# Altium schematic sheet Core.SchDoc
size A4; SheetNumber: 1; SheetTotal: 3
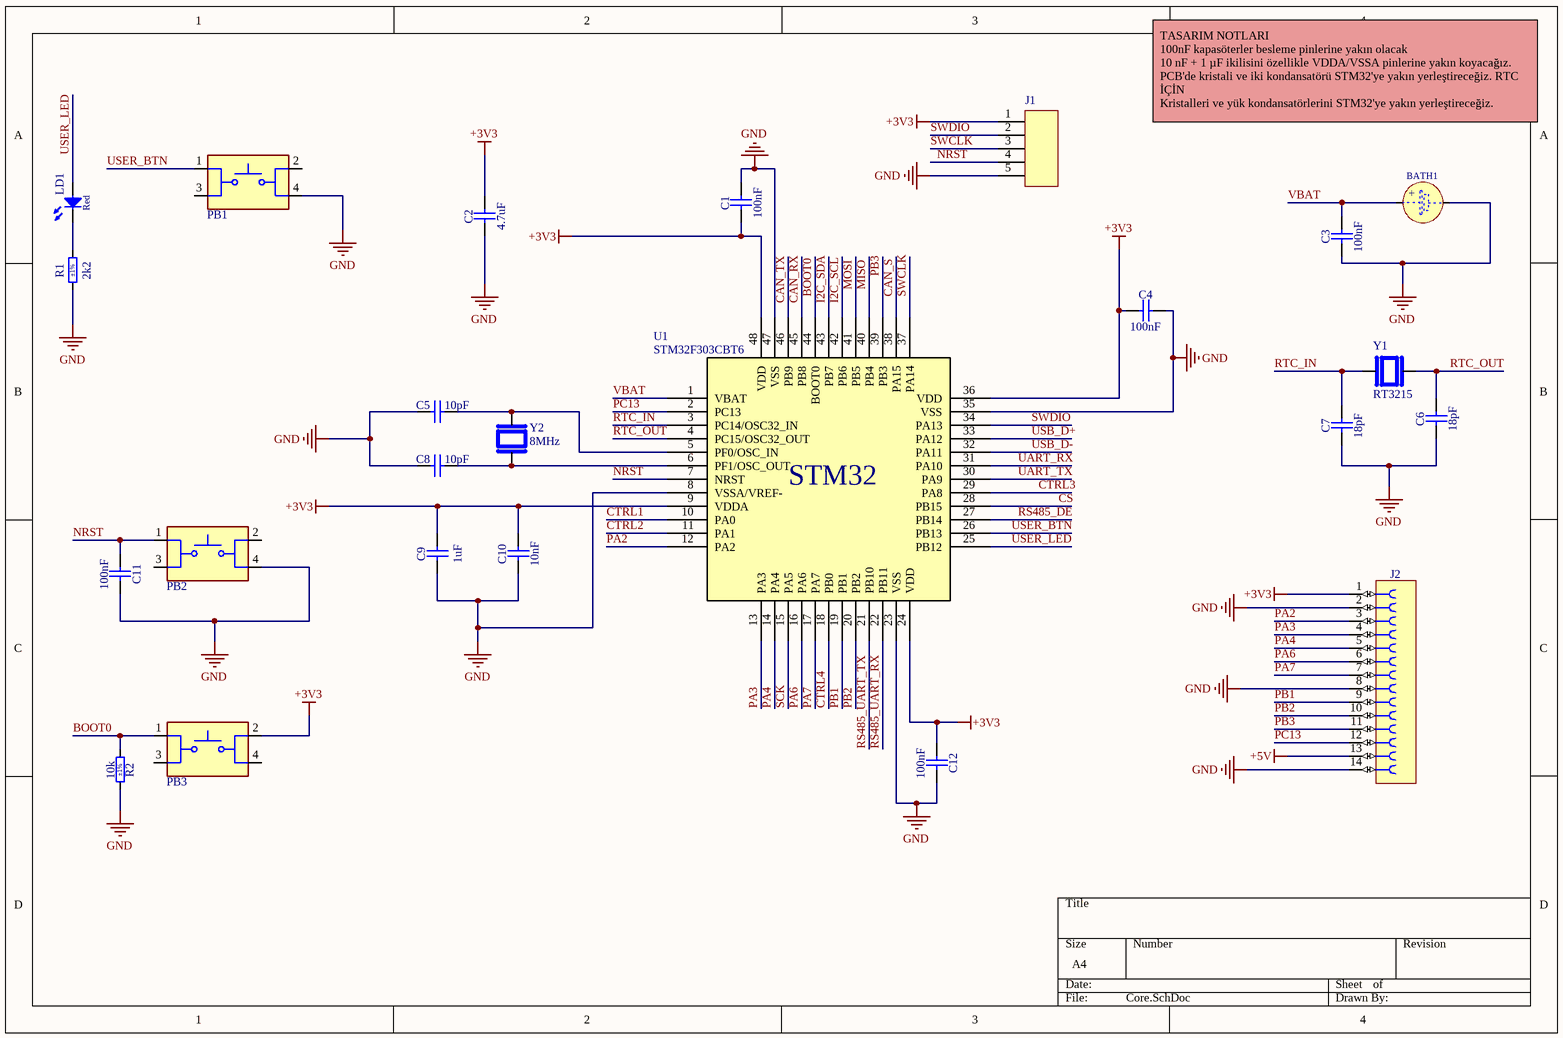
[diagram p0: Core.SchDoc]

## Parts
BATH1  (no value)  [BATH_KEYSTONE_3000]
C1  100nF  [CAPC1608X87N]
C2  4.7uF  [CAPC1608X90N]
C3  100nF  [CAPC1608X87N]
C4  100nF  [CAPC1608X87N]
C5  10pF  [CAPC1608X87N]
C6  18pF  [CAPC1608X87N]
C7  18pF  [CAPC1608X87N]
C8  10pF  [CAPC1608X87N]
C9  1uF  [CAPC1608X87N]
C10  10nF  [CAPC1608X87N]
C11  100nF  [CAPC1608X87N]
C12  100nF  [CAPC1608X87N]
J1  Pin Header 1x5  [Pin Header 1x5 2.54mm]  (value not drawn)
J2  Socket 14  [SAMTEC_SSW-107-01-G-D]  (value not drawn)
LD1  Red  [LED_KINGBRIGHT_KPH-1608SURCK]
PB1  4.5mm x 4.5mm  [L-KLS7-TS4502-6.5-180-T]  (value not drawn)
PB2  4.5mm x 4.5mm  [L-KLS7-TS4502-6.5-180-T]  (value not drawn)
PB3  4.5mm x 4.5mm  [L-KLS7-TS4502-6.5-180-T]  (value not drawn)
R1  2k2  Tolerance: ±1%  [RESC1608X55N]
R2  10k  Tolerance: ±1%  [RESC1608X55N]
U1  STM32F303CBT6  [STM32F303CBT6]
Y1  RT3215  [RT3215-32.768-12.5-TR]
Y2  8MHz  [H130A-8.000-8-2030-TR]

## Nets
+3V3: C1.1 C2.2 C4.1 C9.2 C10.2 C12.1 J1.1 J2.1 PB3.2 U1.9(VDDA) U1.24(VDD) U1.36(VDD) U1.48(VDD)
+5V: J2.13
GND: BATH1.2(MINUS) C1.2 C2.1 C3.1 C4.2 C5.1 C6.1 C7.1 C8.1 C9.1 C10.1 C11.2 C12.2 J1.5 J2.2 J2.8 J2.14 PB1.4 PB2.4 R1.1 R2.2 U1.8(VSSA/VREF-) U1.23(VSS) U1.35(VSS) U1.47(VSS)
BOOT0: PB3.1 R2.1 U1.44(BOOT0)
CAN_RX: U1.45(PB8)
CAN_S: U1.38(PA15)
CAN_TX: U1.46(PB9)
CS: U1.28(PB15)
CTRL1: U1.10(PA0)
CTRL2: U1.11(PA1)
CTRL3: U1.29(PA8)
CTRL4: U1.18(PB0)
I2C_SCL: U1.42(PB6)
I2C_SDA: U1.43(PB7)
MISO: U1.40(PB4)
MOSI: U1.41(PB5)
NRST: C11.1 J1.4 PB2.1 U1.7(NRST)
PA2: J2.3 U1.12(PA2)
PA3: J2.4 U1.13(PA3)
PA4: J2.5 U1.14(PA4)
PA6: J2.6 U1.16(PA6)
PA7: J2.7 U1.17(PA7)
PB1: J2.9 U1.19(PB1)
PB2: J2.10 U1.20(PB2)
PB3: J2.11 U1.39(PB3)
PC13: J2.12 U1.2(PC13)
RS485_DE: U1.27(PB14)
RS485_UART_RX: U1.22(PB11)
RS485_UART_TX: U1.21(PB10)
RTC_IN: C7.2 U1.3(PC14/OSC32_IN) Y1.1
RTC_OUT: C6.2 U1.4(PC15/OSC32_OUT) Y1.2
SCK: U1.15(PA5)
SWCLK: J1.3 U1.37(PA14)
SWDIO: J1.2 U1.34(PA13)
UART_RX: U1.31(PA10)
UART_TX: U1.30(PA9)
USB_D+: U1.33(PA12)
USB_D-: U1.32(PA11)
USER_BTN: PB1.1 U1.26(PB13)
USER_LED: LD1.2(A) U1.25(PB12)
VBAT: BATH1.1(PLUS) C3.2 U1.1(VBAT)
NetC5_2: C5.2 U1.5(PF0/OSC_IN) Y2.2
NetC8_2: C8.2 U1.6(PF1/OSC_OUT) Y2.1
NetLD1_1: LD1.1(C) R1.2

Not connected (* = marked no-connect by the designer): PB1 2 3; PB2 2 3; PB3 3 4

## Notes on the sheet
- TASARIM NOTLARI
  100nF kapasöterler besleme pinlerine yakın olacak
  10 nF + 1 µF ikilisini özellikle VDDA/VSSA pinlerine yakın koyacağız.
  PCB'de kristali ve iki kondansatörü STM32'ye yakın yerleştireceğiz. RTC İÇİN
  Kristalleri ve yük kondansatörlerini STM32'ye yakın yerleştireceğiz.
- (in symbol BATH_KEYSTONE_3000) +
- (in symbol STM32F303CBT6) STM32

## Library data of the parts
BATH1 = BATH_KEYSTONE_3000: Battery Holder whit 2 Pin; Part Description: SMD Battery Holder for CR1216, BR1220, CL1225, SR1120, D381, 391, 191 Coin Cells; Manufacturer Part Number: 3000; PressFit: No; Part Number: BATH_KEYSTONE_3000; Component Kind: Standard; Component Type: Standard; Pin Count: 3; PackageDescription: SMD Battery Holder for CR1216, BR1220, CL1225, SR1120, D381, 391, 191 Coin Cells; Family: Battery; Mounted: Yes; Socket: No; SMD: Yes; Sense: No; Manufacturer: KEYSTONE; ComponentHeight: 3.17mm; HelpURL: \\cern.ch\dfs\Applications\Altium\Datasheets\BATH_KEYSTONE_3000.pdf; Author: CERN DEM JLC; CreateDate: 17.04.2012; LatestRevisionDate: 7.06.2017
C1 C3 C4 C11 C12 = CC0603_100NF_50V_10%_X5R: Non-polarised capacitor; Part Description: SMD Multilayer Chip Ceramic Capacitor; Manufacturer: GENERIC; Manufacturer1 Part Number: C1608X5R1H104K080; Voltage: 50V; TC: X5R; Tolerance: ±10%; Part Number: CC0603_100NF_50V_10%_X5R; Component Kind: Standard; Component Type: Standard; Pin Count: 2; Value: 100nF; Status: None; Manufacturer Part Number: CC0603_100NF_50V_10%_X5R; Case: 0603; Mounted: Yes; Socket: No; SMD: Yes; Sense: No; Manufacturer1 Example: TDK; Manufacturer1 ComponentHeight: 0.9mm; HelpURL: \\cern.ch\dfs\Applications\Altium\Datasheets\CC0603_X5R_TDK_C.pdf; Author: CERN DEM MR; CreateDate: 8.01.2016; LatestRevisionDate: 8.01.2016
C2 = CC0603_4.7UF_25V_10%_X5R: Non-polarised capacitor; Part Description: SMD Multilayer Chip Ceramic Capacitor; Manufacturer: GENERIC; Manufacturer1 Part Number: GRM188R61E475KE11D; Voltage: 25V; TC: X5R; Tolerance: ±10%; Part Number: CC0603_4.7UF_25V_10%_X5R; Component Kind: Standard; Component Type: Standard; Pin Count: 2; Value: 4.7uF; Status: None; Manufacturer Part Number: CC0603_4.7UF_25V_10%_X5R; Case: 0603; Mounted: Yes; Socket: No; SMD: Yes; Sense: No; Manufacturer1 Example: MURATA; Manufacturer1 ComponentHeight: 0.95mm; HelpURL: \\cern.ch\dfs\Applications\Altium\Datasheets\CC0603_MURATA_GRM188R61E475KE11D.pdf; Author: CERN DEM JLC; CreateDate: 10.11.2014; LatestRevisionDate: 10.11.2014
C5 C8 = CC0603_10PF_50V_5%_NP0: Non-polarised capacitor; Part Description: SMD Multilayer Chip Ceramic Capacitor; Manufacturer: GENERIC; Manufacturer1 Part Number: 223886715109; Voltage: 50V; TC: C0G/NP0; Tolerance: ±5%; Part Number: CC0603_10PF_50V_5%_NP0; Component Kind: Standard; Component Type: Standard; Pin Count: 2; Value: 10pF; Status: Preferred; Manufacturer Part Number: CC0603_10PF_50V_5%_NP0; Case: 0603; Mounted: Yes; Socket: No; SMD: Yes; Sense: No; Manufacturer1 Example: PHYCOMP; Manufacturer1 ComponentHeight: 0.87mm; HelpURL: \\cern.ch\dfs\Applications\Altium\Datasheets\CC0603_NP0_PHYCOMP.pdf; Author: CERN DEM JLC; CreateDate: 3.12.2007; LatestRevisionDate: 3.12.2007
C6 C7 = CC0603_18PF_50V_5%_NP0: Non-polarised capacitor; Part Description: SMD Multilayer Chip Ceramic Capacitor; Manufacturer: GENERIC; Manufacturer1 Part Number: 223886715189; Voltage: 50V; TC: C0G/NP0; Tolerance: ±5%; Part Number: CC0603_18PF_50V_5%_NP0; Component Kind: Standard; Component Type: Standard; Pin Count: 2; Value: 18pF; Status: Preferred; Manufacturer Part Number: CC0603_18PF_50V_5%_NP0; Case: 0603; Mounted: Yes; Socket: No; SMD: Yes; Sense: No; Manufacturer1 Example: PHYCOMP; Manufacturer1 ComponentHeight: 0.87mm; HelpURL: \\cern.ch\dfs\Applications\Altium\Datasheets\CC0603_NP0_PHYCOMP.pdf; Author: CERN DEM JLC; CreateDate: 3.12.2007; LatestRevisionDate: 3.12.2007
C9 = CC0603_1UF_25V_10%_X7R: Non-polarised capacitor; Part Description: SMD Multilayer Chip Ceramic Capacitor; Manufacturer: GENERIC; Manufacturer1 Part Number: GRM188R71E105KA12D; Voltage: 25V; TC: X7R; Tolerance: ±10%; Part Number: CC0603_1UF_25V_10%_X7R; Component Kind: Standard; Component Type: Standard; Pin Count: 2; Value: 1uF; Status: None; Manufacturer Part Number: CC0603_1UF_25V_10%_X7R; Case: 0603; Mounted: Yes; Socket: No; SMD: Yes; Sense: No; Manufacturer1 Example: MURATA; Manufacturer1 ComponentHeight: 0.9mm; HelpURL: \\cern.ch\dfs\Applications\Altium\Datasheets\CC0603_X7R_MURATA.pdf; Author: CERN DEM JLC; CreateDate: 18.01.2011; LatestRevisionDate: 18.01.2011
C10 = CC0603_10NF_50V_10%_X7R: Non-polarised capacitor; Part Description: SMD Multilayer Chip Ceramic Capacitor; Manufacturer: GENERIC; Manufacturer1 Part Number: 223858615636; Voltage: 50V; TC: X7R; Tolerance: ±10%; Part Number: CC0603_10NF_50V_10%_X7R; Component Kind: Standard; Component Type: Standard; Pin Count: 2; Value: 10nF; Status: Preferred; Manufacturer Part Number: CC0603_10NF_50V_10%_X7R; Case: 0603; Mounted: Yes; Socket: No; SMD: Yes; Sense: No; Manufacturer1 Example: PHYCOMP; Manufacturer1 ComponentHeight: 0.87mm; HelpURL: \\cern.ch\dfs\Applications\Altium\Datasheets\CC0603_X7R_PHYCOMP.pdf; Author: CERN DEM JLC; CreateDate: 3.12.2007; LatestRevisionDate: 3.12.2007
J1 = Pin Header 1x5 2.54mm: PIN HEADER 5PIN(1x5) 2.54mm THT V/T 3X6MM
J2 = SAMTEC_SSW-107-01-G-D: Connector 14 Female; Part Description: 14 Contacts, Pitch 2.54mm, Dual Row Through Mount Straight Socket (Lead Length 2.64mm); Manufacturer: SAMTEC; PressFit: No; Part Number: SAMTEC_SSW-107-01-G-D; Component Kind: Standard; Component Type: Standard; Pin Count: 14; Family: Socket 14; Mounted: Yes; Socket: No; SMD: No; Sense: No; Status: None; Manufacturer Part Number: SSW-107-01-G-D; ComponentHeight: 8.51mm; HelpURL: \\cern.ch\dfs\Applications\Altium\Datasheets\SAMTEC_SSW-107-01-G-D.pdf; Author: CERN DEM MR; CreateDate: 10.03.2016; LatestRevisionDate: 10.03.2016
LD1 = LED_KINGBRIGHT_KPH-1608SURCK: LED Red 1C 2A; Part Description: SMD Hyper Red LED, Case 1.6mmX0.8mm(0603), 0.65mm Thickness; PressFit: No; Bonding: No; Part Number: LED_KINGBRIGHT_KPH-1608SURCK; Component Kind: Standard; Component Type: Standard; Color: Red; PackageDescription: SMT Hyper Red LED, Case 0603, Body L 1.6 x W 0.8mm H 0.65mm; Manufacturer: KINGBRIGHT; Manufacturer Part Number: KPH-1608SURCK; Pin Count: 2; Case: 0603; Mounted: Yes; Socket: No; SMD: Yes; Sense: No; ComponentHeight: 0.65mm; HelpURL: \\cern.ch\dfs\Applications\Altium\Datasheets\LED_KINGBRIGHT_KPH-1608SURCK.pdf; Author: CERN DEM JLC; CreateDate: 3.07.2017; LatestRevisionDate: 3.07.2017
PB1-PB3 = L-KLS7-TS4502-6.5-180-T: SWITCH TACT 4.5x4.5MM 6.5MM 180gf SMD
R1 = R0603_2K2_1%_0.1W_100PPM: Resistor - 1%; Part Description: General Purpose Thick Film Chip Resistor; Manufacturer: GENERIC; Manufacturer1 Part Number: NRC06F2201TRF; Power: 0.1W; TC: ±100ppm/°C; PressFit: No; Part Number: R0603_2K2_1%_0.1W_100PPM; Component Kind: Standard; Component Type: Standard; Pin Count: 2; Value: 2k2; Status: Preferred; Manufacturer Part Number: R0603_2K2_1%_0.1W_100PPM; Case: 0603; Mounted: Yes; Sense: No; Socket: No; SMD: Yes; Manufacturer1 Example: NIC COMPONENT; Manufacturer1 ComponentHeight: 0.55mm; HelpURL: \\cern.ch\dfs\Applications\Altium\Datasheets\R0603_NIC_NRC.pdf; Author: CERN DEM JLC; CreateDate: 3.12.2007; LatestRevisionDate: 13.03.2008
R2 = R0603_10K_1%_0.1W_100PPM: Resistor - 1%; Part Description: General Purpose Thick Film Chip Resistor; Manufacturer: GENERIC; Manufacturer1 Part Number: NRC06F1002TRF; Power: 0.1W; TC: ±100ppm/°C; PressFit: No; Part Number: R0603_10K_1%_0.1W_100PPM; Component Kind: Standard; Component Type: Standard; Pin Count: 2; Value: 10k; Status: Preferred; Manufacturer Part Number: R0603_10K_1%_0.1W_100PPM; Case: 0603; Mounted: Yes; Sense: No; Socket: No; SMD: Yes; Manufacturer1 Example: NIC COMPONENT; Manufacturer1 ComponentHeight: 0.55mm; HelpURL: \\cern.ch\dfs\Applications\Altium\Datasheets\R0603_NIC_NRC.pdf; Author: CERN DEM JLC; CreateDate: 3.12.2007; LatestRevisionDate: 13.03.2008
Y1 = RT3215-32.768-12.5-TR: CRYSTAL 32.768kHz 12.5pF 20PPM SMD TR
Y2 = H130A-8.000-8-2030-TR: CRYSTAL 8MHz 8pF 20PPM SMT